# Altium schematic sheet IDC_Tester_v1_LED_3.SchDoc
size 420 x 297 mm; SheetNumber: 5; SheetTotal: 9
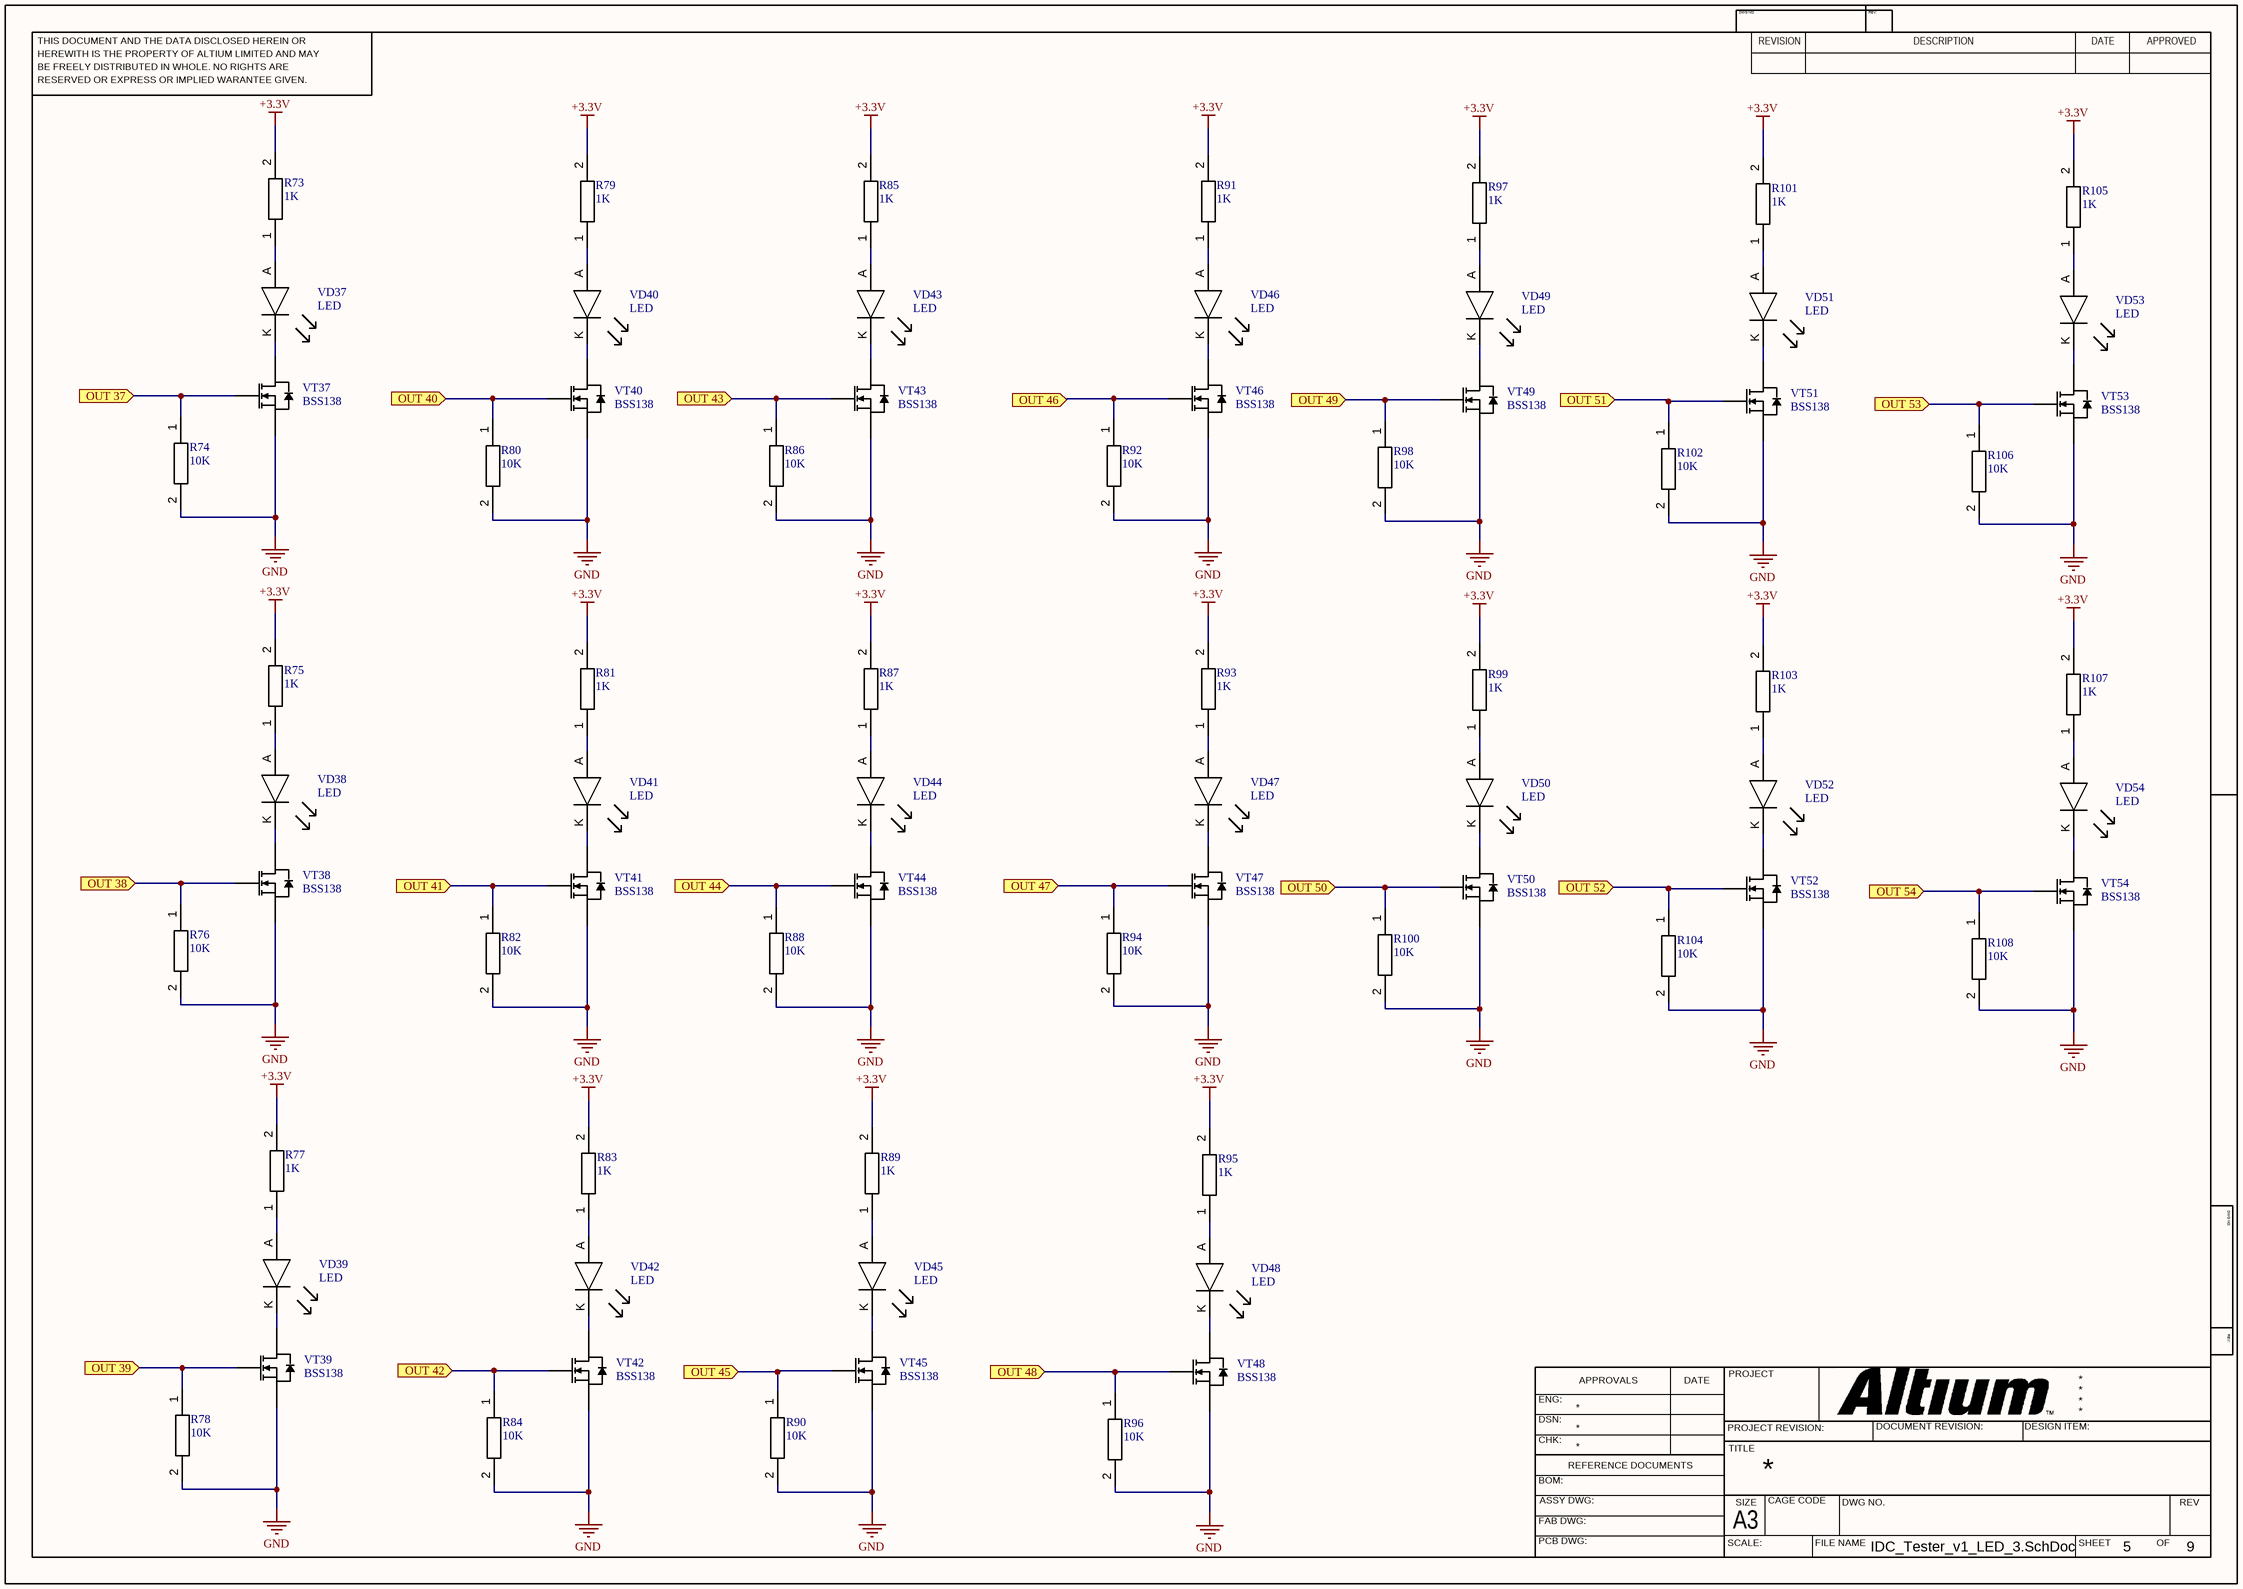
[diagram p0: IDC_Tester_v1_LED_3.SchDoc]

## Parts
R73  1K  [Resistor 0603]
R74  10K  [Resistor 0603]
R75  1K  [Resistor 0603]
R76  10K  [Resistor 0603]
R77  1K  [Resistor 0603]
R78  10K  [Resistor 0603]
R79  1K  [Resistor 0603]
R80  10K  [Resistor 0603]
R81  1K  [Resistor 0603]
R82  10K  [Resistor 0603]
R83  1K  [Resistor 0603]
R84  10K  [Resistor 0603]
R85  1K  [Resistor 0603]
R86  10K  [Resistor 0603]
R87  1K  [Resistor 0603]
R88  10K  [Resistor 0603]
R89  1K  [Resistor 0603]
R90  10K  [Resistor 0603]
R91  1K  [Resistor 0603]
R92  10K  [Resistor 0603]
R93  1K  [Resistor 0603]
R94  10K  [Resistor 0603]
R95  1K  [Resistor 0603]
R96  10K  [Resistor 0603]
R97  1K  [Resistor 0603]
R98  10K  [Resistor 0603]
R99  1K  [Resistor 0603]
R100  10K  [Resistor 0603]
R101  1K  [Resistor 0603]
R102  10K  [Resistor 0603]
R103  1K  [Resistor 0603]
R104  10K  [Resistor 0603]
R105  1K  [Resistor 0603]
R106  10K  [Resistor 0603]
R107  1K  [Resistor 0603]
R108  10K  [Resistor 0603]
VD37  LED  [Led 0603 - duplicate]
VD38  LED  [Led 0603 - duplicate]
VD39  LED  [Led 0603 - duplicate]
VD40  LED  [Led 0603 - duplicate]
VD41  LED  [Led 0603 - duplicate]
VD42  LED  [Led 0603 - duplicate]
VD43  LED  [Led 0603 - duplicate]
VD44  LED  [Led 0603 - duplicate]
VD45  LED  [Led 0603 - duplicate]
VD46  LED  [Led 0603 - duplicate]
VD47  LED  [Led 0603 - duplicate]
VD48  LED  [Led 0603 - duplicate]
VD49  LED  [Led 0603 - duplicate]
VD50  LED  [Led 0603 - duplicate]
VD51  LED  [Led 0603 - duplicate]
VD52  LED  [Led 0603 - duplicate]
VD53  LED  [Led 0603 - duplicate]
VD54  LED  [Led 0603 - duplicate]
VT37  BSS138  [SOT-23-3]
VT38  BSS138  [SOT-23-3]
VT39  BSS138  [SOT-23-3]
VT40  BSS138  [SOT-23-3]
VT41  BSS138  [SOT-23-3]
VT42  BSS138  [SOT-23-3]
VT43  BSS138  [SOT-23-3]
VT44  BSS138  [SOT-23-3]
VT45  BSS138  [SOT-23-3]
VT46  BSS138  [SOT-23-3]
VT47  BSS138  [SOT-23-3]
VT48  BSS138  [SOT-23-3]
VT49  BSS138  [SOT-23-3]
VT50  BSS138  [SOT-23-3]
VT51  BSS138  [SOT-23-3]
VT52  BSS138  [SOT-23-3]
VT53  BSS138  [SOT-23-3]
VT54  BSS138  [SOT-23-3]

## Ports
OUT 37 (in), OUT 38 (in), OUT 39 (in), OUT 40 (in), OUT 41 (in), OUT 42 (in), OUT 43 (in), OUT 44 (in), OUT 45 (in), OUT 46 (in), OUT 47 (in), OUT 48 (in), OUT 49 (in), OUT 50 (in), OUT 51 (in), OUT 52 (in), OUT 53 (in), OUT 54 (in)

## Nets
+3.3V: R73.2 R75.2 R77.2 R79.2 R81.2 R83.2 R85.2 R87.2 R89.2 R91.2 R93.2 R95.2 R97.2 R99.2 R101.2 R103.2 R105.2 R107.2
GND: R74.2 R76.2 R78.2 R80.2 R82.2 R84.2 R86.2 R88.2 R90.2 R92.2 R94.2 R96.2 R98.2 R100.2 R102.2 R104.2 R106.2 R108.2 VT37.2(S) VT38.2(S) VT39.2(S) VT40.2(S) VT41.2(S) VT42.2(S) VT43.2(S) VT44.2(S) VT45.2(S) VT46.2(S) VT47.2(S) VT48.2(S) VT49.2(S) VT50.2(S) VT51.2(S) VT52.2(S) VT53.2(S) VT54.2(S)
OUT 37: R74.1 VT37.1(G) ; port OUT 37
OUT 38: R76.1 VT38.1(G) ; port OUT 38
OUT 39: R78.1 VT39.1(G) ; port OUT 39
OUT 40: R80.1 VT40.1(G) ; port OUT 40
OUT 41: R82.1 VT41.1(G) ; port OUT 41
OUT 42: R84.1 VT42.1(G) ; port OUT 42
OUT 43: R86.1 VT43.1(G) ; port OUT 43
OUT 44: R88.1 VT44.1(G) ; port OUT 44
OUT 45: R90.1 VT45.1(G) ; port OUT 45
OUT 46: R92.1 VT46.1(G) ; port OUT 46
OUT 47: R94.1 VT47.1(G) ; port OUT 47
OUT 48: R96.1 VT48.1(G) ; port OUT 48
OUT 49: R98.1 VT49.1(G) ; port OUT 49
OUT 50: R100.1 VT50.1(G) ; port OUT 50
OUT 51: R102.1 VT51.1(G) ; port OUT 51
OUT 52: R104.1 VT52.1(G) ; port OUT 52
OUT 53: R106.1 VT53.1(G) ; port OUT 53
OUT 54: R108.1 VT54.1(G) ; port OUT 54
NetR73_1: R73.1 VD37.A
NetR75_1: R75.1 VD38.A
NetR77_1: R77.1 VD39.A
NetR79_1: R79.1 VD40.A
NetR81_1: R81.1 VD41.A
NetR83_1: R83.1 VD42.A
NetR85_1: R85.1 VD43.A
NetR87_1: R87.1 VD44.A
NetR89_1: R89.1 VD45.A
NetR91_1: R91.1 VD46.A
NetR93_1: R93.1 VD47.A
NetR95_1: R95.1 VD48.A
NetR97_1: R97.1 VD49.A
NetR99_1: R99.1 VD50.A
NetR101_1: R101.1 VD51.A
NetR103_1: R103.1 VD52.A
NetR105_1: R105.1 VD53.A
NetR107_1: R107.1 VD54.A
NetVD37_K: VD37.K VT37.3(D)
NetVD38_K: VD38.K VT38.3(D)
NetVD39_K: VD39.K VT39.3(D)
NetVD40_K: VD40.K VT40.3(D)
NetVD41_K: VD41.K VT41.3(D)
NetVD42_K: VD42.K VT42.3(D)
NetVD43_K: VD43.K VT43.3(D)
NetVD44_K: VD44.K VT44.3(D)
NetVD45_K: VD45.K VT45.3(D)
NetVD46_K: VD46.K VT46.3(D)
NetVD47_K: VD47.K VT47.3(D)
NetVD48_K: VD48.K VT48.3(D)
NetVD49_K: VD49.K VT49.3(D)
NetVD50_K: VD50.K VT50.3(D)
NetVD51_K: VD51.K VT51.3(D)
NetVD52_K: VD52.K VT52.3(D)
NetVD53_K: VD53.K VT53.3(D)
NetVD54_K: VD54.K VT54.3(D)

## Notes on the sheet
- THIS DOCUMENT AND THE DATA DISCLOSED HEREIN OR
- HEREWITH IS THE PROPERTY OF ALTIUM LIMITED AND MAY
- DWG NO:
- REVISION
- REV:
- DESCRIPTION
- DATE
- APPROVED
- BE FREELY DISTRIBUTED IN WHOLE. NO RIGHTS ARE
- RESERVED OR EXPRESS OR IMPLIED WARANTEE GIVEN.
- ENG:
- APPROVALS
- PROJECT
- DSN:
- CHK:
- REFERENCE DOCUMENTS
- PROJECT REVISION:
- TITLE
- DOCUMENT REVISION:
- DESIGN ITEM:
- BOM:
- FAB DWG:
- PCB DWG:
- ASSY DWG:
- SCALE:
- A3
- SIZE
- CAGE CODE
- FILE NAME
- DWG NO.
- SHEET
- OF
- REV

## Library data of the parts
R73 R75 R77 R79 R81 R83 R85 R87 R89 R91 R93 R95 R97 R99 R101 R103 R105 R107 = Resistor 1K: Part Number: SMD RES 1K OHM 1%±100ppm/°C 0603 (RMCF0603FT1K00); Added by: viskov2055@gmail.com; Mount_Type: SMD; Solder_Amount: 2; Pkg: 0603; Created at: 13/02/2024; Mount: MOUNT
R74 R76 R78 R80 R82 R84 R86 R88 R90 R92 R94 R96 R98 R100 R102 R104 R106 R108 = Resistor 10K: Part Number: SMD RES 10K OHM 1%±100ppm/°C 0603 (RMCF0603FT10K0); Added by: viskov2055@gmail.com; Mount_Type: SMD; Solder_Amount: 2; Pkg: 0603; Created at: 15/02/2024; Mount: MOUNT
VD37-VD54 = LED: LED Uni-Color Green 515nm 2-Pin SMD T/R; Manufacturer: Kingbright; Manufacturer Part Number: APG1608ZGCK; Lens Style: Flat; Lens Transparency: Clear; Luminous Intensity: 400mcd; Forward Voltage: 3.3V; Test Current: 20mA; Viewing Angle: 130°; Dominant Wavelength: 525nm; Lens Size: 0.8mm; Added by: viskov2055@gmail.com; Solder_Amount: 2; Pkg: 0603; RoHS: Yes; Category: LEDs; Stock 1: 44996; Pricing 1: 1=0,6, 10=0,368, 100=0,2114, 1000=0,16544, 2000=0,15165 (USD); MountType: SMD; Case/Package: 0603; Color: Green; Case Code (Imperial): 0603; Case Code (Metric): 1608; Packaging: Tape and Reel; Length: 1.6mm; Width: 0.8mm; Height: 0.28mm; RoHS Compliant: Yes; ComponentLink1URL: https://datasheet.octopart.com/APG1608ZGCK-Kingbright-datasheet-153682089.pdf?src-supplier=Future+Electronics; ComponentLink1Description: https://datasheet.octopart.com/APG1608ZGCK-Kingbright-datasheet-153682089.pdf?src-supplier=Future+Electronics; ComponentLink2URL: http://www.kingbrightusa.com/images/catalog/SPEC/APG1608ZGCK.pdf?src-supplier=Digikey; ComponentLink2Description: http://www.kingbrightusa.com/images/catalog/SPEC/APG1608ZGCK.pdf?src-supplier=Digikey; ComponentLink3URL: https://datasheet.octopart.com/APG1608ZGCK-Kingbright-datasheet-137408059.pdf?src-supplier=Sager+Electronics; ComponentLink3Description: https://datasheet.octopart.com/APG1608ZGCK-Kingbright-datasheet-137408059.pdf?src-supplier=Sager+Electronics; Supplier Part Number 1: 754-2113-1-ND; Created at: 13/02/2024; Mount: MOUNT; Part Number: APG1608ZGCK; Supplier 1: Digikey
VT37-VT54 = BSS138: N-Channel Logic Level Enhancement Mode Field Effect Transistor; Solder_Amount: 3; Added_by: ma_lubushkin@teslatec.ru; Pkg: SOT-23; Part Number: BSS138; Mount: MOUNT; MountType: SMD; Created_at: 03/12/2019